# Altium schematic sheet ADL S PCH 600 CLOCK_PCIE.schdoc
size 420 x 298 mm; Symbol: Sheet-Symbol_A3; Company: 嘉立创EDA; Version: V1.0; Page Size: A3; @Project Name: H610(2024/12/09); @Page Count: 36; @Update Date: 2025-10-09; @Create Date: 2025-10-09; @Schematic Name: SCHEMATIC1; @Page No: 9; @Page Name: ADL S PCH 600 CLOCK/PCIE; Device: Sheet-Symbol_A3; @Board Name: SCHEMATIC1; @Create Time: 10:15:40; @Update Time: 10:18:17
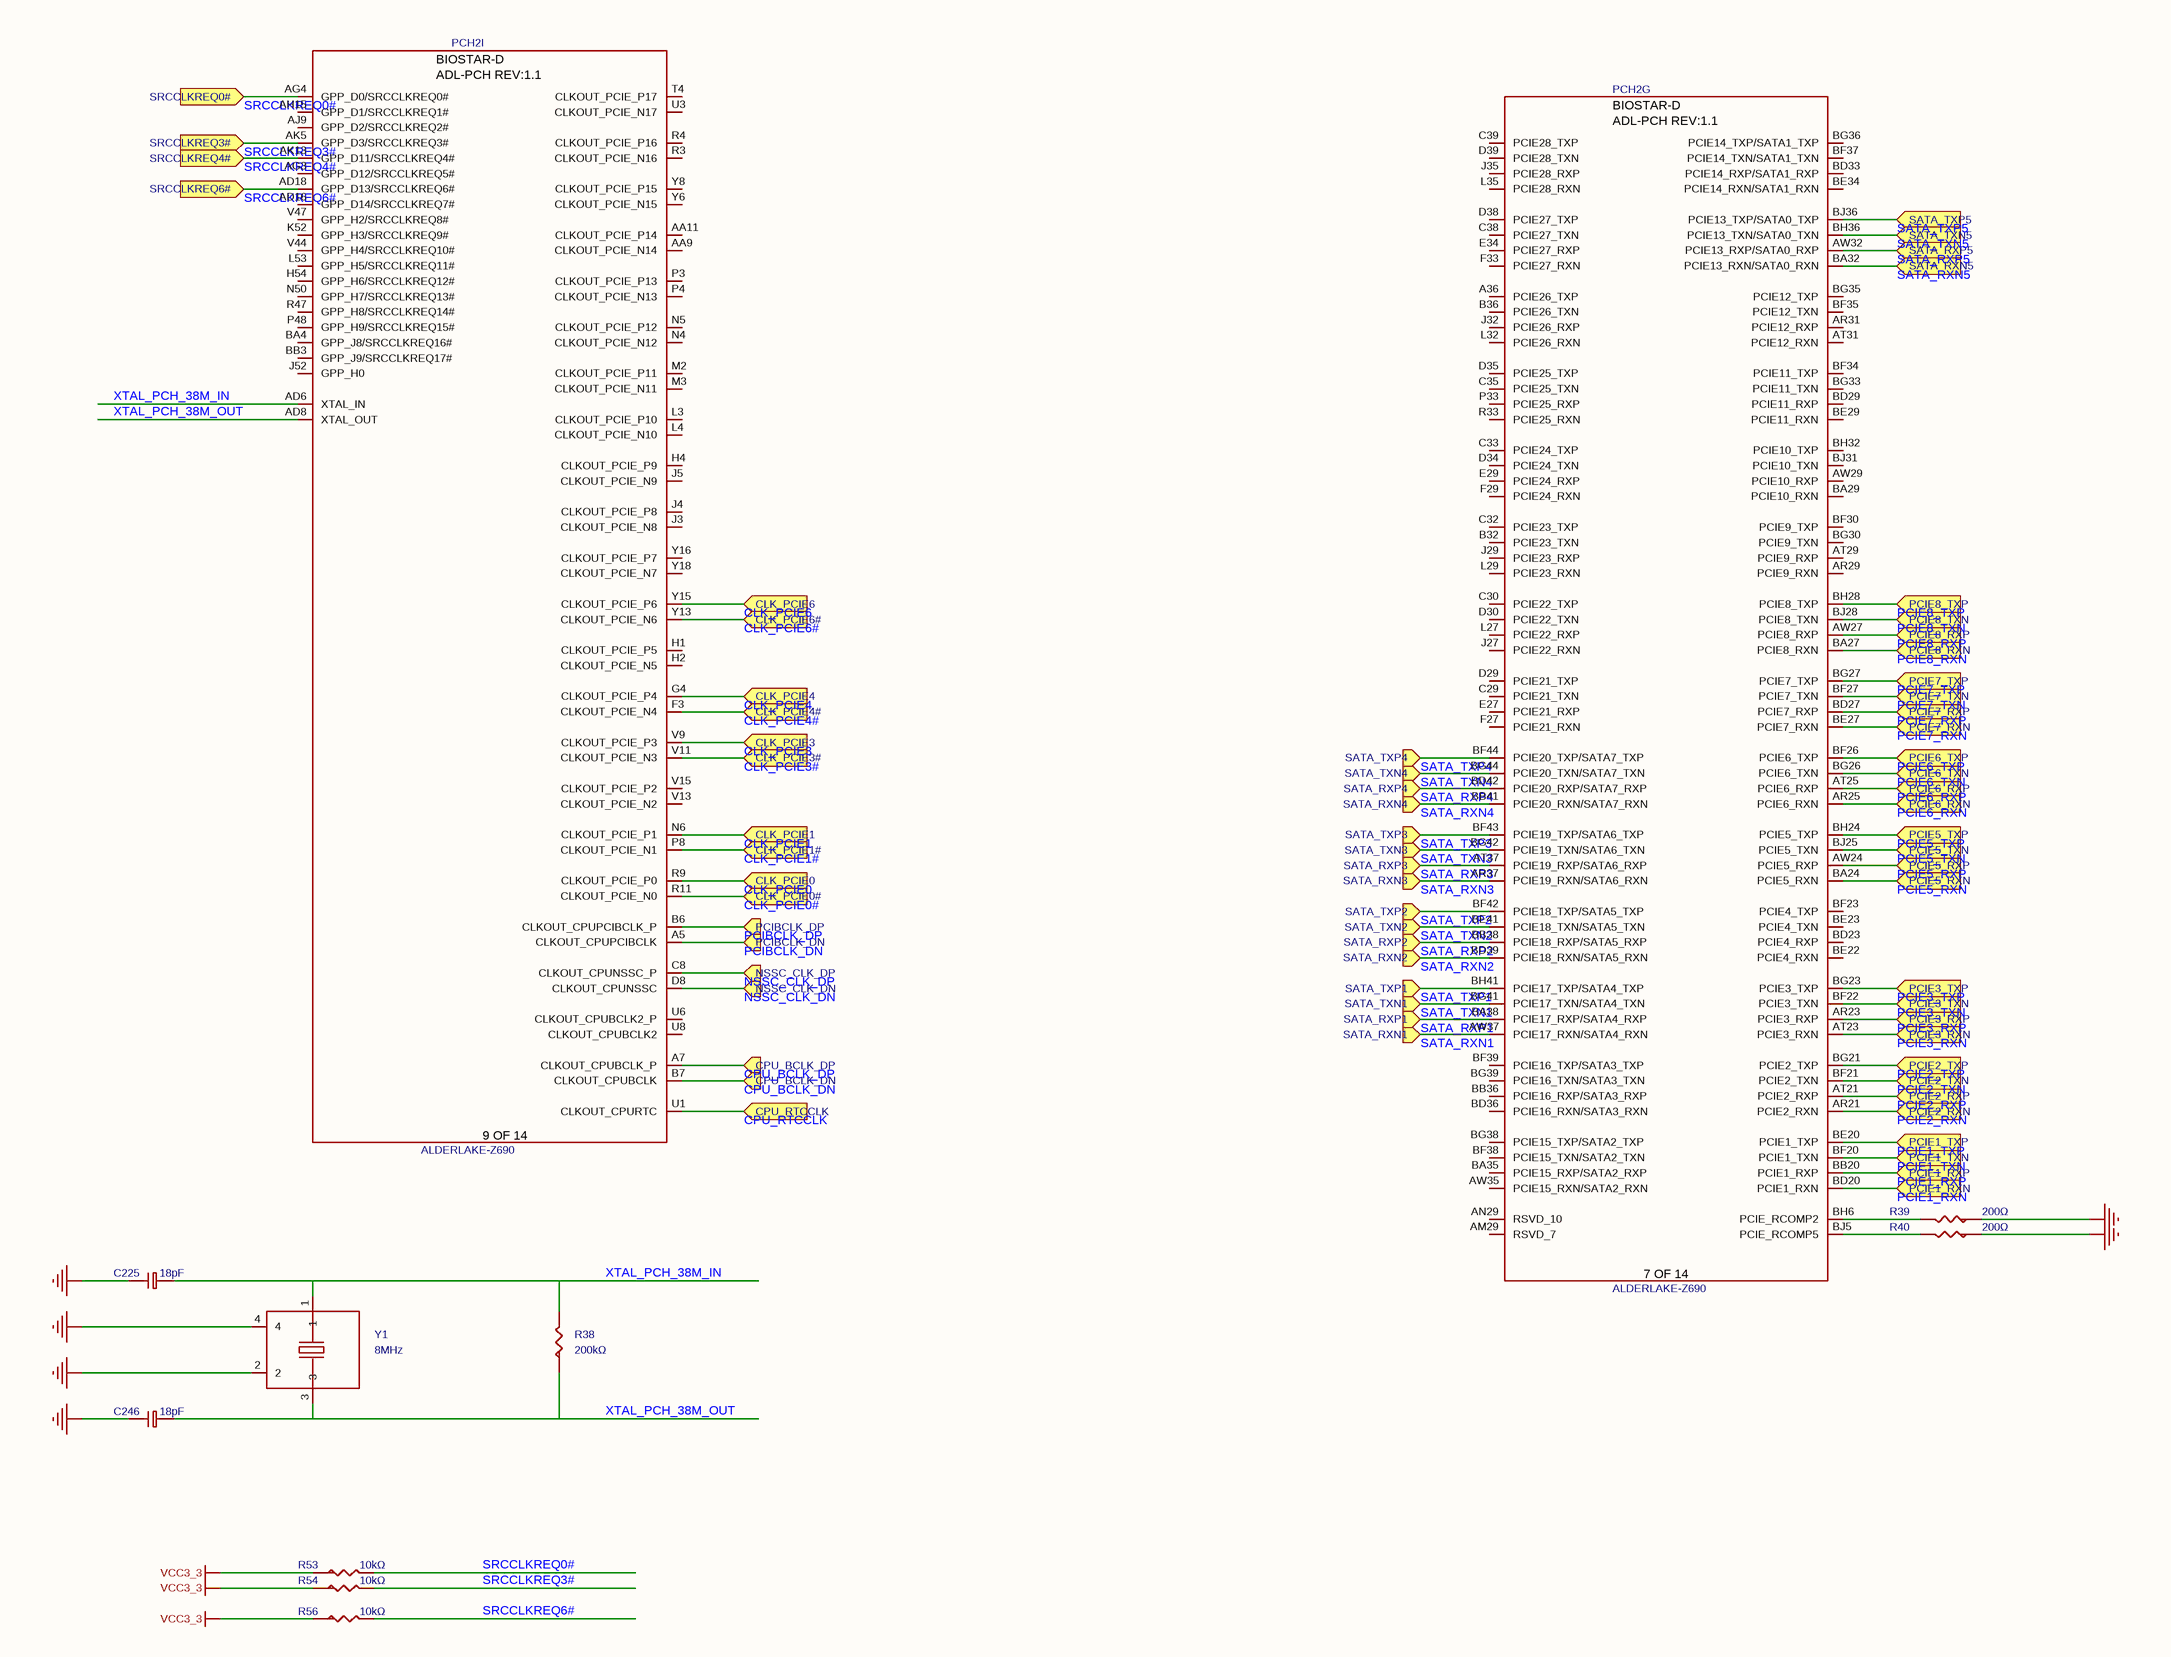
[diagram p0: ADL S PCH 600 CLOCK_PCIE.schdoc]

## Parts
C225  18pF  [C0402_1]
C246  18pF  [C0402_3]
PCH2  value ALDERLAKE-Z690  [BGA1045_28X25MM-ADL]  (hidden comment: ADL_S_PCH_EXT_4)  (parts G,I of 14)
R38  200kΩ  [R0402_1]
R39  200Ω  [R0402_2]
R40  200Ω  [R0402_2]
R53  10kΩ  [R0402_1]
R54  10kΩ  [R0402_1]
R56  10kΩ  [R0402_2]
Y1  8MHz  [SMD3225]

## Ports
CLK_PCIE0 (in), CLK_PCIE0# (in), CLK_PCIE1 (in), CLK_PCIE1# (in), CLK_PCIE3 (in), CLK_PCIE3# (in), CLK_PCIE4 (in), CLK_PCIE4# (in), CLK_PCIE6 (in), CLK_PCIE6# (in), CPU_BCLK_DN (in), CPU_BCLK_DP (in), CPU_RTCCLK (in), NSSC_CLK_DN (in), NSSC_CLK_DP (in), PCIBCLK_DN (in), PCIBCLK_DP (in), PCIE1_RXN (in), PCIE1_RXP (in), PCIE1_TXN (in), PCIE1_TXP (in), PCIE2_RXN (in), PCIE2_RXP (in), PCIE2_TXN (in), PCIE2_TXP (in), PCIE3_RXN (in), PCIE3_RXP (in), PCIE3_TXN (in), PCIE3_TXP (in), PCIE5_RXN (in), PCIE5_RXP (in), PCIE5_TXN (in), PCIE5_TXP (in), PCIE6_RXN (in), PCIE6_RXP (in), PCIE6_TXN (in), PCIE6_TXP (in), PCIE7_RXN (in), PCIE7_RXP (in), PCIE7_TXN (in), PCIE7_TXP (in), PCIE8_RXN (in), PCIE8_RXP (in), PCIE8_TXN (in), PCIE8_TXP (in), SATA_RXN1 (in), SATA_RXN2 (in), SATA_RXN3 (in), SATA_RXN4 (in), SATA_RXN5 (in), SATA_RXP1 (in), SATA_RXP2 (in), SATA_RXP3 (in), SATA_RXP4 (in), SATA_RXP5 (in), SATA_TXN1 (in), SATA_TXN2 (in), SATA_TXN3 (in), SATA_TXN4 (in), SATA_TXN5 (in), SATA_TXP1 (in), SATA_TXP2 (in), SATA_TXP3 (in), SATA_TXP4 (in), SATA_TXP5 (in), SRCCLKREQ0# (in), SRCCLKREQ3# (in), SRCCLKREQ4# (in), SRCCLKREQ6# (in)

## Nets
GND: C225.2 C246.2 R39.1 R40.1 Y1.2 Y1.4
VCC3_3: R53.1 R54.1 R56.1
CLK_PCIE0: PCH2.R9(CLKOUT_PCIE_P0) ; port CLK_PCIE0
CLK_PCIE0#: PCH2.R11(CLKOUT_PCIE_N0) ; port CLK_PCIE0#
CLK_PCIE1: PCH2.N6(CLKOUT_PCIE_P1) ; port CLK_PCIE1
CLK_PCIE1#: PCH2.P8(CLKOUT_PCIE_N1) ; port CLK_PCIE1#
CLK_PCIE3: PCH2.V9(CLKOUT_PCIE_P3) ; port CLK_PCIE3
CLK_PCIE3#: PCH2.V11(CLKOUT_PCIE_N3) ; port CLK_PCIE3#
CLK_PCIE4: PCH2.G4(CLKOUT_PCIE_P4) ; port CLK_PCIE4
CLK_PCIE4#: PCH2.F3(CLKOUT_PCIE_N4) ; port CLK_PCIE4#
CLK_PCIE6: PCH2.Y15(CLKOUT_PCIE_P6) ; port CLK_PCIE6
CLK_PCIE6#: PCH2.Y13(CLKOUT_PCIE_N6) ; port CLK_PCIE6#
CPU_BCLK_DN: PCH2.B7(CLKOUT_CPUBCLK) ; port CPU_BCLK_DN
CPU_BCLK_DP: PCH2.A7(CLKOUT_CPUBCLK_P) ; port CPU_BCLK_DP
CPU_RTCCLK: PCH2.U1(CLKOUT_CPURTC) ; port CPU_RTCCLK
NSSC_CLK_DN: PCH2.D8(CLKOUT_CPUNSSC) ; port NSSC_CLK_DN
NSSC_CLK_DP: PCH2.C8(CLKOUT_CPUNSSC_P) ; port NSSC_CLK_DP
PCIBCLK_DN: PCH2.A5(CLKOUT_CPUPCIBCLK) ; port PCIBCLK_DN
PCIBCLK_DP: PCH2.B6(CLKOUT_CPUPCIBCLK_P) ; port PCIBCLK_DP
PCIE1_RXN: PCH2.BD20(PCIE1_RXN) ; port PCIE1_RXN
PCIE1_RXP: PCH2.BB20(PCIE1_RXP) ; port PCIE1_RXP
PCIE1_TXN: PCH2.BF20(PCIE1_TXN) ; port PCIE1_TXN
PCIE1_TXP: PCH2.BE20(PCIE1_TXP) ; port PCIE1_TXP
PCIE2_RXN: PCH2.AR21(PCIE2_RXN) ; port PCIE2_RXN
PCIE2_RXP: PCH2.AT21(PCIE2_RXP) ; port PCIE2_RXP
PCIE2_TXN: PCH2.BF21(PCIE2_TXN) ; port PCIE2_TXN
PCIE2_TXP: PCH2.BG21(PCIE2_TXP) ; port PCIE2_TXP
PCIE3_RXN: PCH2.AT23(PCIE3_RXN) ; port PCIE3_RXN
PCIE3_RXP: PCH2.AR23(PCIE3_RXP) ; port PCIE3_RXP
PCIE3_TXN: PCH2.BF22(PCIE3_TXN) ; port PCIE3_TXN
PCIE3_TXP: PCH2.BG23(PCIE3_TXP) ; port PCIE3_TXP
PCIE5_RXN: PCH2.BA24(PCIE5_RXN) ; port PCIE5_RXN
PCIE5_RXP: PCH2.AW24(PCIE5_RXP) ; port PCIE5_RXP
PCIE5_TXN: PCH2.BJ25(PCIE5_TXN) ; port PCIE5_TXN
PCIE5_TXP: PCH2.BH24(PCIE5_TXP) ; port PCIE5_TXP
PCIE6_RXN: PCH2.AR25(PCIE6_RXN) ; port PCIE6_RXN
PCIE6_RXP: PCH2.AT25(PCIE6_RXP) ; port PCIE6_RXP
PCIE6_TXN: PCH2.BG26(PCIE6_TXN) ; port PCIE6_TXN
PCIE6_TXP: PCH2.BF26(PCIE6_TXP) ; port PCIE6_TXP
PCIE7_RXN: PCH2.BE27(PCIE7_RXN) ; port PCIE7_RXN
PCIE7_RXP: PCH2.BD27(PCIE7_RXP) ; port PCIE7_RXP
PCIE7_TXN: PCH2.BF27(PCIE7_TXN) ; port PCIE7_TXN
PCIE7_TXP: PCH2.BG27(PCIE7_TXP) ; port PCIE7_TXP
PCIE8_RXN: PCH2.BA27(PCIE8_RXN) ; port PCIE8_RXN
PCIE8_RXP: PCH2.AW27(PCIE8_RXP) ; port PCIE8_RXP
PCIE8_TXN: PCH2.BJ28(PCIE8_TXN) ; port PCIE8_TXN
PCIE8_TXP: PCH2.BH28(PCIE8_TXP) ; port PCIE8_TXP
SATA_RXN1: PCH2.AW37(PCIE17_RXN/SATA4_RXN) ; port SATA_RXN1
SATA_RXN2: PCH2.BD39(PCIE18_RXN/SATA5_RXN) ; port SATA_RXN2
SATA_RXN3: PCH2.AR37(PCIE19_RXN/SATA6_RXN) ; port SATA_RXN3
SATA_RXN4: PCH2.BB41(PCIE20_RXN/SATA7_RXN) ; port SATA_RXN4
SATA_RXN5: PCH2.BA32(PCIE13_RXN/SATA0_RXN) ; port SATA_RXN5
SATA_RXP1: PCH2.BA38(PCIE17_RXP/SATA4_RXP) ; port SATA_RXP1
SATA_RXP2: PCH2.BB38(PCIE18_RXP/SATA5_RXP) ; port SATA_RXP2
SATA_RXP3: PCH2.AT37(PCIE19_RXP/SATA6_RXP) ; port SATA_RXP3
SATA_RXP4: PCH2.BD42(PCIE20_RXP/SATA7_RXP) ; port SATA_RXP4
SATA_RXP5: PCH2.AW32(PCIE13_RXP/SATA0_RXP) ; port SATA_RXP5
SATA_TXN1: PCH2.BG41(PCIE17_TXN/SATA4_TXN) ; port SATA_TXN1
SATA_TXN2: PCH2.BE41(PCIE18_TXN/SATA5_TXN) ; port SATA_TXN2
SATA_TXN3: PCH2.BG42(PCIE19_TXN/SATA6_TXN) ; port SATA_TXN3
SATA_TXN4: PCH2.BG44(PCIE20_TXN/SATA7_TXN) ; port SATA_TXN4
SATA_TXN5: PCH2.BH36(PCIE13_TXN/SATA0_TXN) ; port SATA_TXN5
SATA_TXP1: PCH2.BH41(PCIE17_TXP/SATA4_TXP) ; port SATA_TXP1
SATA_TXP2: PCH2.BF42(PCIE18_TXP/SATA5_TXP) ; port SATA_TXP2
SATA_TXP3: PCH2.BF43(PCIE19_TXP/SATA6_TXP) ; port SATA_TXP3
SATA_TXP4: PCH2.BF44(PCIE20_TXP/SATA7_TXP) ; port SATA_TXP4
SATA_TXP5: PCH2.BJ36(PCIE13_TXP/SATA0_TXP) ; port SATA_TXP5
SRCCLKREQ0#: PCH2.AG4(GPP_D0/SRCCLKREQ0#) R53.2 ; port SRCCLKREQ0#
SRCCLKREQ3#: PCH2.AK5(GPP_D3/SRCCLKREQ3#) R54.2 ; port SRCCLKREQ3#
SRCCLKREQ4#: PCH2.AK13(GPP_D11/SRCCLKREQ4#) ; port SRCCLKREQ4#
SRCCLKREQ6#: PCH2.AD18(GPP_D13/SRCCLKREQ6#) R56.2 ; port SRCCLKREQ6#
XTAL_PCH_38M_IN: C225.1 PCH2.AD6(XTAL_IN) R38.2 Y1.1
XTAL_PCH_38M_OUT: C246.1 PCH2.AD8(XTAL_OUT) R38.1 Y1.3
NetPCH2_BH6: PCH2.BH6(PCIE_RCOMP2) R39.2
NetPCH2_BJ5: PCH2.BJ5(PCIE_RCOMP5) R40.2

Not connected (* = marked no-connect by the designer): PCH2 A36(PCIE26_TXP) AA9(CLKOUT_PCIE_N14) AA11(CLKOUT_PCIE_P14) AD16(GPP_D14/SRCCLKREQ7#) AG3(GPP_D12/SRCCLKREQ5#) AH15(GPP_D1/SRCCLKREQ1#) AJ9(GPP_D2/SRCCLKREQ2#) AM29(RSVD_7) AN29(RSVD_10) AR29(PCIE9_RXN) AR31(PCIE12_RXP) AT29(PCIE9_RXP) AT31(PCIE12_RXN) AW29(PCIE10_RXP) AW35(PCIE15_RXN/SATA2_RXN) B32(PCIE23_TXN) B36(PCIE26_TXN) BA4(GPP_J8/SRCCLKREQ16#) BA29(PCIE10_RXN) BA35(PCIE15_RXP/SATA2_RXP) BB3(GPP_J9/SRCCLKREQ17#) BB36(PCIE16_RXP/SATA3_RXP) BD23(PCIE4_RXP) BD29(PCIE11_RXP) BD33(PCIE14_RXP/SATA1_RXP) BD36(PCIE16_RXN/SATA3_RXN) BE22(PCIE4_RXN) BE23(PCIE4_TXN) BE29(PCIE11_RXN) BE34(PCIE14_RXN/SATA1_RXN) BF23(PCIE4_TXP) BF30(PCIE9_TXP) BF34(PCIE11_TXP) BF35(PCIE12_TXN) BF37(PCIE14_TXN/SATA1_TXN) BF38(PCIE15_TXN/SATA2_TXN) BF39(PCIE16_TXP/SATA3_TXP) BG30(PCIE9_TXN) BG33(PCIE11_TXN) BG35(PCIE12_TXP) BG36(PCIE14_TXP/SATA1_TXP) BG38(PCIE15_TXP/SATA2_TXP) BG39(PCIE16_TXN/SATA3_TXN) BH32(PCIE10_TXP) BJ31(PCIE10_TXN) C29(PCIE21_TXN) C30(PCIE22_TXP) C32(PCIE23_TXP) C33(PCIE24_TXP) C35(PCIE25_TXN) C38(PCIE27_TXN) C39(PCIE28_TXP) D29(PCIE21_TXP) D30(PCIE22_TXN) D34(PCIE24_TXN) D35(PCIE25_TXP) D38(PCIE27_TXP) D39(PCIE28_TXN) E27(PCIE21_RXP) E29(PCIE24_RXP) E34(PCIE27_RXP) F27(PCIE21_RXN) F29(PCIE24_RXN) F33(PCIE27_RXN) H1(CLKOUT_PCIE_P5) H2(CLKOUT_PCIE_N5) H4(CLKOUT_PCIE_P9) H54(GPP_H6/SRCCLKREQ12#) J3(CLKOUT_PCIE_N8) J4(CLKOUT_PCIE_P8) J5(CLKOUT_PCIE_N9) J27(PCIE22_RXN) J29(PCIE23_RXP) J32(PCIE26_RXP) J35(PCIE28_RXP) J52(GPP_H0) K52(GPP_H3/SRCCLKREQ9#) L3(CLKOUT_PCIE_P10) L4(CLKOUT_PCIE_N10) L27(PCIE22_RXP) L29(PCIE23_RXN) L32(PCIE26_RXN) L35(PCIE28_RXN) L53(GPP_H5/SRCCLKREQ11#) M2(CLKOUT_PCIE_P11) M3(CLKOUT_PCIE_N11) N4(CLKOUT_PCIE_N12) N5(CLKOUT_PCIE_P12) N50(GPP_H7/SRCCLKREQ13#) P3(CLKOUT_PCIE_P13) P4(CLKOUT_PCIE_N13) P33(PCIE25_RXP) P48(GPP_H9/SRCCLKREQ15#) R3(CLKOUT_PCIE_N16) R4(CLKOUT_PCIE_P16) R33(PCIE25_RXN) R47(GPP_H8/SRCCLKREQ14#) T4(CLKOUT_PCIE_P17) U3(CLKOUT_PCIE_N17) U6(CLKOUT_CPUBCLK2_P) U8(CLKOUT_CPUBCLK2) V13(CLKOUT_PCIE_N2) V15(CLKOUT_PCIE_P2) V44(GPP_H4/SRCCLKREQ10#) V47(GPP_H2/SRCCLKREQ8#) Y6(CLKOUT_PCIE_N15) Y8(CLKOUT_PCIE_P15) Y16(CLKOUT_PCIE_P7) Y18(CLKOUT_PCIE_N7)

## Notes on the sheet
- 更新日期
- 2025-10-09
- 原理图
- 图页
- SCHEMATIC1
- ADL S PCH 600 CLOCK/PCIE
- 创建日期
- 物料编码
- 审阅
- 绘制
- H610(2024/12/09)
- 版本
- V1.0
- 尺寸
- A3
- 页
- 9
- 嘉立创EDA
- 共
- 36
- (in symbol ADL_S_PCH_EXT_4, part G) BIOSTAR-D; ADL-PCH REV:1.1; 7 OF 14
- (in symbol ADL_S_PCH_EXT_4, part I) BIOSTAR-D; ADL-PCH REV:1.1; 9 OF 14

## Library data of the parts
C225 C246 = CC0402FRNPO9BN180: 容值:18pF;精度:±1%;额定电压:50V;材质(温度系数):NP0;; Manufacturer: YAGEO(国巨); Symbol: CAP; PCB Footprint: C0402; Tolerance: ±1%; AddInBom: yes; ModelId: 36a51122f27c49738f86b3bfa98863e0; ModelName: C0402_L1.0-W0.5-H0.5; ModelTransform: 39.37,19.685,0,0,0,0,0,0,0; Voltage Rated: 50V; Temperature Coefficient: NP0; Device: CC0402FRNPO9BN180; Value: 18pF; LCSC Part Name: 18pF ±1% 50V; SupplierPart: C541431; ManufacturerPart: CC0402FRNPO9BN180; Supplier Footprint: 0402; JLCPCB Part Class: Extended Part; Datasheet: https://atta.szlcsc.com/upload/public/pdf/source/20200615/C541431_FAFCAA54FB89671184DDCAE44D787100.pdf; Supplier: LCSC; ConvertToPcb: yes
  C225: FootprintName: C0402_1
  C246: FootprintName: C0402_3
PCH2 = ADL_S_PCH_EXT_4: H610南桥; Check: false; AddInBom: yes; Device: ADL_S_PCH_EXT_4; Symbol: ADL_S_PCH_EXT_4; FootprintName: BGA1045_28X25MM-ADL; ConvertToPcb: yes
R38 = 0402WGF2003TCE: 电阻类型:厚膜电阻;阻值:200kΩ;精度:±1%;功率:62.5mW;; Manufacturer: UNI-ROYAL(厚声); Symbol: 42A**-F; PCB Footprint: R0402; ModelId: 671aefced39d4c318694bba8bd8efd39; Tolerance: ±1%; AddInBom: yes; Power(Watts): 62.5mW; ModelName: R0402_L1.0-W0.5-H0.5; ModelTransform: 39.37,19.685,0,0,0,0,0,0.0005,0; Overload Voltage (Max): 50V; Temperature Coefficient: ±100ppm/℃; Device: 0402WGF2003TCE; Value: 200kΩ; Type: 厚膜电阻; Supplier: LCSC; Datasheet: https://atta.szlcsc.com/upload/public/pdf/source/20200306/C422600_1E6D84923E4A46A82E41ADD87F860B5C.pdf; FootprintName: R0402_1; SupplierPart: C25764; ConvertToPcb: yes; LCSC Part Name: 200kΩ ±1% 62.5mW; JLCPCB Part Class: Basic Part; ManufacturerPart: 0402WGF2003TCE; Supplier Footprint: 0402; Operating Temperature Range: -55℃~+155℃
R39 R40 = 0402WGF2000TCE: 电阻类型:厚膜电阻;阻值:200Ω;精度:±1%;功率:62.5mW;; Manufacturer: UNI-ROYAL(厚声); Symbol: 42A**-F; PCB Footprint: R0402; ModelId: 671aefced39d4c318694bba8bd8efd39; Tolerance: ±1%; AddInBom: yes; Power(Watts): 62.5mW; ModelName: R0402_L1.0-W0.5-H0.5; ModelTransform: 39.37,19.685,0,0,0,0,0,0.0005,0; Overload Voltage (Max): 50V; Temperature Coefficient: ±100ppm/℃; Device: 0402WGF2000TCE; Value: 200Ω; Type: 厚膜电阻; Supplier: LCSC; Datasheet: https://atta.szlcsc.com/upload/public/pdf/source/20200306/C422600_1E6D84923E4A46A82E41ADD87F860B5C.pdf; FootprintName: R0402_2; SupplierPart: C25087; ConvertToPcb: yes; LCSC Part Name: 200Ω ±1% 62.5mW; JLCPCB Part Class: Basic Part; ManufacturerPart: 0402WGF2000TCE; Supplier Footprint: 0402; Operating Temperature Range: -55℃~+155℃
R53 R54 R56 = 0402WGF1002TCE: 电阻类型:厚膜电阻;阻值:10kΩ;精度:±1%;功率:62.5mW;; Manufacturer: UNI-ROYAL(厚声); Symbol: 42A**-F; PCB Footprint: R0402; ModelId: 671aefced39d4c318694bba8bd8efd39; Tolerance: ±1%; AddInBom: yes; Power(Watts): 62.5mW; ModelName: R0402_L1.0-W0.5-H0.5; ModelTransform: 39.37,19.685,0,0,0,0,0,0.0005,0; Overload Voltage (Max): 50V; Temperature Coefficient: ±100ppm/℃; Device: 0402WGF1002TCE; Value: 10kΩ; Type: 厚膜电阻; Supplier: LCSC; Datasheet: https://atta.szlcsc.com/upload/public/pdf/source/20200306/C422600_1E6D84923E4A46A82E41ADD87F860B5C.pdf; SupplierPart: C25744; ConvertToPcb: yes; LCSC Part Name: 10kΩ ±1% 62.5mW; JLCPCB Part Class: Basic Part; ManufacturerPart: 0402WGF1002TCE; Supplier Footprint: 0402; Operating Temperature Range: -55℃~+155℃
  R53 R54: FootprintName: R0402_1
  R56: FootprintName: R0402_2
Y1 = X32258MOB4SI: 晶振类型:贴片晶振;频率:8MHz;常温频差:±10ppm;外接负载电容:12pF;频率稳定度(全温):±20ppm;; Manufacturer: YXC(扬兴晶振); Symbol: 25M_0; AddInBom: yes; ModelId: ae22b8d143894765bc8100c37cb6356f; ModelName: OSC-SMD_4P-L3.2-W2.5-H1.0; ModelTransform: 125.984,98.425,0,0,0,0,0,0,0; Crystal Type: 贴片晶振; Normal temperature Frequency Tolerance: ±10ppm; External load capacitor: 12pF; Frequency Stability(Full temperature range): ±20ppm; Equivalent Series Resistance (ESR): 150Ω; Device: X32258MOB4SI; Value: 8MHz; JLCPCB Part Class: Extended Part; LCSC Part Name: 8MHz ±10ppm 12pF; SupplierPart: C2682775; ManufacturerPart: X32258MOB4SI; Supplier Footprint: SMD3225-4P; Datasheet: https://atta.szlcsc.com/upload/public/pdf/source/20240329/19D5F850207469550BEB00D7DFEDBC7A.pdf; Supplier: LCSC; ConvertToPcb: yes; FootprintName: SMD3225; Operating Temperature: -40℃~+85℃